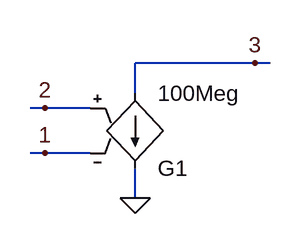
[diagram p0: schematic myopaB.asc]
myopaB.asc, the LTspice schematic file:
Version 4.1
SHEET 1 880 680
WIRE 368 80 240 80
WIRE 384 80 368 80
WIRE 240 112 240 80
WIRE 144 128 128 128
WIRE 192 128 144 128
WIRE 144 176 128 176
WIRE 192 176 144 176
WIRE 240 224 240 192
FLAG 240 224 0
FLAG 144 176 1
FLAG 144 128 2
FLAG 368 80 3
SYMBOL g2 240 208 M180
SYMATTR InstName G1
SYMATTR Value 100Meg

The netlist it stands for:
* myopaB.asc
G1 3 0 2 1 100Meg
.backanno
.end